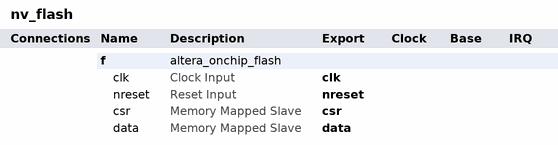
[diagram p0: system contents]
# Platform Designer (Qsys) system nv_flash, MAX 10 10M50DAF484C7G
# Parameters at their usual value, and those the tool derives, are not listed.
package require -exact qsys 25.1
create_system nv_flash
set_project_property DEVICE_FAMILY {MAX 10}
set_project_property DEVICE 10M50DAF484C7G

add_instance f altera_onchip_flash 25.1
set_instance_parameter_value f CLOCK_FREQUENCY 50.0
set_instance_parameter_value f CONFIGURATION_MODE {Single Compressed Image with Memory Initialization}
set_instance_parameter_value f READ_BURST_COUNT 2
set_instance_parameter_value f SECTOR_ACCESS_MODE {Read and write,Read and write,Hidden,Hidden,Hidden}
set_instance_parameter_value f initFlashContent false
set_instance_parameter_value f initializationFileName altera_onchip_flash.hex
set_instance_parameter_value f useNonDefaultInitFile false

# exported interfaces
add_interface clk clock sink
set_interface_property clk EXPORT_OF f.clk
add_interface csr avalon slave
set_interface_property csr EXPORT_OF f.csr
add_interface data avalon slave
set_interface_property data EXPORT_OF f.data
add_interface nreset reset sink
set_interface_property nreset EXPORT_OF f.nreset

set_interconnect_requirement {$system} qsys_mm.clockCrossingAdapter HANDSHAKE
set_interconnect_requirement {$system} qsys_mm.enableEccProtection FALSE
set_interconnect_requirement {$system} qsys_mm.insertDefaultSlave FALSE
set_interconnect_requirement {$system} qsys_mm.maxAdditionalLatency 1

save_system nv_flash.qsys
